# Altium project Phaser.PrjPCB (part 11 of 11)
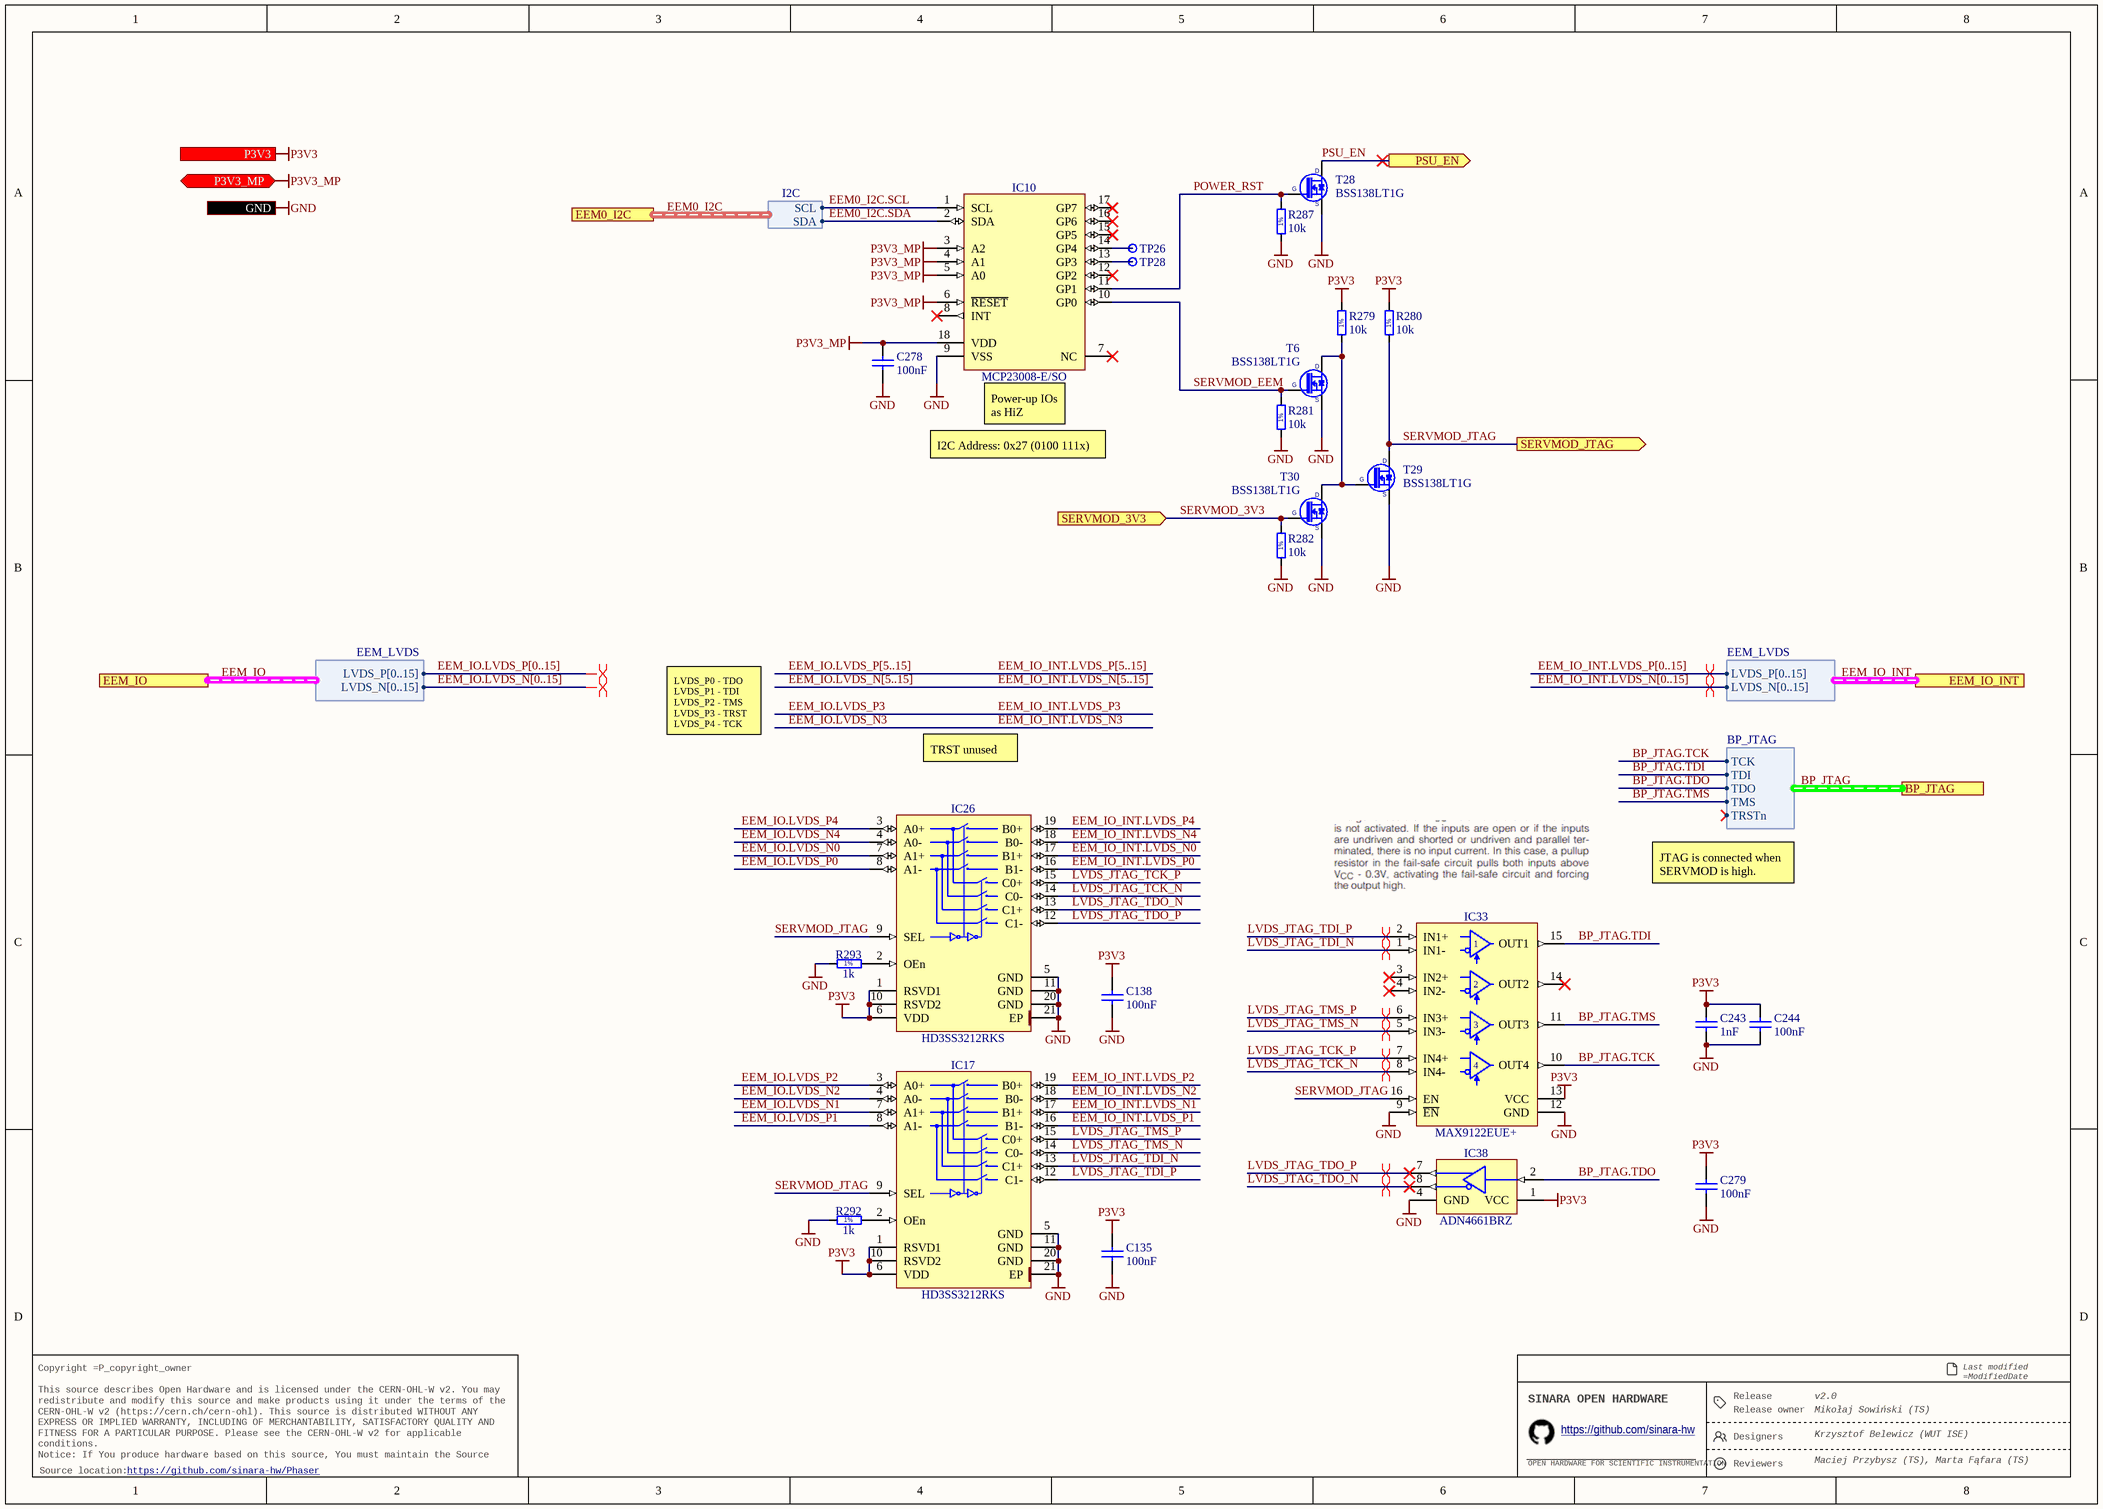
[diagram p129: JTAG_Switch.SchDoc]

## Assembly variants
EEM_Baseband: not fitted B14B B15B B16B B17B B18B B19B C11 C30A C30B C31 C32 C37 C43A C43B C44A C44B C45A C45B C46A C46B C126A C126B C127A C127B C128A C128B C129A C129B C130A C130B C133A C133B C134A C134B C146 C153A C153B C154A C154B C246A C246B C280A C280B C281A C281B C282A C282B C283A C283B C284A C284B C285A C285B C286A C286B C287A C287B C288A C288B C289A C289B C354A C354B C355A C355B C356A C356B C357A C357B C358A C358B C369A C369B C369C C369D C370A C370B C370C C370D C371A C371B C371C C371D C372A C372B C372C C372D C373A C373B C373C C373D C374A C374B C374C C374D C375A C375B C375C C375D C376A C376B C376C C376D C377A C377B C377C C377D C382 C383 C384 C385 C386 C387 C388 C389 HS3A HS3B IC2A IC2B IC34 J9 J14A J14B J16 J17 L19A L19B L20A L20B L22A L22B L24A L24B L25A L25B L27A L27B L29A L29B L31A L31B L33A L33B L34A L34B L35A L35B L38A L38B L52A L52B R2 R3 R8A R8B R11 R12 R13 R14 R15 R16 R17 R21 R24 R27 R31 R32 R37 R38A R38B R39 R40 R41A R41B R42 R45 R46 R47 R49A R49B R50 R52 R54 R56 R59 R61 R62 R63 R66 R67 R68 R69 R70 R71A R71B R73 R76 R77 R81 R85 R86 R98A R98B R150 R156 R157 R193A R193B R194A R194B R195A R195B R196A R196B R224A R224B R225A R225B R226A R226B R227 R228 R229 R230 R231 R232 R244 R245 R257 R282 T30 T_IC3 T_IC5 T_J4 T_J5 T_R2 T_R4 T_R11 T_R12 T_R35 T_R36 T_R37 T_R38 T_R39 T_R40 T_R41 T_R42 T_R43 T_R44 T_R45 T_R46 T_R47 T_R48 T_R49 T_R50 T_R51 T_R52 T_R53 T_R54 T_R55 T_R56 T_R57 T_R58 T_R59 T_R60 T_R61 T_R62 T_R63 T_R64 T_R65 T_R66 TR6A TR6B TR7 TR9 TR10 TR11; alternate parts T_R26 -> R0805_0R_JUMPER
EEM_Upconverter: not fitted C11 C14A C14B C15A C15B C16A C16B C31 C32 C37 C146 C270A C270B C272A C272B C273A C273B C274A C274B C275A C275B C276A C276B C369C C369D C370C C370D C371C C371D C372C C372D C373C C373D C374C C374D C375C C375D C376C C376D C377C C377D IC34 J9 L29A L29B L31A L31B L33A L33B L38A L38B R2 R3 R8A R8B R11 R12 R13 R14 R15 R16 R17 R21 R24 R27 R31 R32 R37 R38A R38B R39 R40 R41A R41B R42 R45 R46 R47 R50 R52 R54 R56 R59 R61 R62 R63 R66 R67 R68 R69 R70 R73 R76 R77 R81 R85 R86 R98A R98B R150 R156 R157 R227 R228 R229 R230 R231 R232 R236 R245 R246 R247 R249 R250 R251 R252 R253 R254 R282 T30 T_IC3 T_IC5 T_J4 T_J5 T_R2 T_R4 T_R11 T_R12 T_R35 T_R36 T_R37 T_R38 T_R39 T_R40 T_R41 T_R42 T_R43 T_R44 T_R45 T_R46 T_R47 T_R48 T_R49 T_R50 T_R51 T_R52 T_R53 T_R54 T_R55 T_R56 T_R57 T_R58 T_R59 T_R60 T_R61 T_R62 T_R63 T_R64 T_R65 T_R66 TR3 TR4 TR5 TR8; alternate parts T_R26 -> R0805_0R_JUMPER
DIOT_Baseband: not fitted B14B B15B B16B B17B B18B B19B C11 C30A C30B C31 C32 C37 C43A C43B C44A C44B C45A C45B C46A C46B C126A C126B C127A C127B C128A C128B C129A C129B C130A C130B C133A C133B C134A C134B C146 C153A C153B C154A C154B C246A C246B C280A C280B C281A C281B C282A C282B C283A C283B C284A C284B C285A C285B C286A C286B C287A C287B C288A C288B C289A C289B C354A C354B C355A C355B C356A C356B C357A C357B C358A C358B C369A C369B C369C C369D C370A C370B C370C C370D C371A C371B C371C C371D C372A C372B C372C C372D C373A C373B C373C C373D C374A C374B C374C C374D C375A C375B C375C C375D C376A C376B C376C C376D C377A C377B C377C C377D C382 C383 C384 C385 C386 C387 C388 C389 HS3A HS3B IC2A IC2B IC34 J9 J14A J14B J16 J17 L19A L19B L20A L20B L22A L22B L24A L24B L25A L25B L27A L27B L29A L29B L31A L31B L33A L33B L34A L34B L35A L35B L38A L38B L52A L52B R2 R3 R8A R8B R11 R12 R13 R14 R15 R16 R17 R21 R24 R27 R31 R32 R37 R38A R38B R39 R40 R41A R41B R42 R45 R46 R47 R49A R49B R50 R52 R54 R56 R59 R61 R62 R63 R66 R67 R68 R69 R70 R71A R71B R73 R76 R77 R81 R85 R86 R98A R98B R150 R156 R157 R193A R193B R194A R194B R195A R195B R196A R196B R224A R224B R225A R225B R226A R226B R227 R228 R229 R230 R231 R232 R244 R245 R257 R282 T30 T_IC3 T_IC5 T_J1 T_J2 T_R9 T_R10 TR6A TR6B TR7 TR9 TR10 TR11
DIOT_Upconverter: not fitted C11 C14A C14B C15A C15B C16A C16B C31 C32 C37 C146 C270A C270B C272A C272B C273A C273B C274A C274B C275A C275B C276A C276B C369C C369D C370C C370D C371C C371D C372C C372D C373C C373D C374C C374D C375C C375D C376C C376D C377C C377D IC34 J9 L29A L29B L31A L31B L33A L33B L38A L38B R2 R3 R8A R8B R11 R12 R13 R14 R15 R16 R17 R21 R24 R27 R31 R32 R37 R38A R38B R39 R40 R41A R41B R42 R45 R46 R47 R50 R52 R54 R56 R59 R61 R62 R63 R66 R67 R68 R69 R70 R73 R76 R77 R81 R85 R86 R98A R98B R150 R156 R157 R227 R228 R229 R230 R231 R232 R236 R245 R246 R247 R249 R250 R251 R252 R253 R254 R282 T30 T_IC3 T_IC5 T_J1 T_J2 T_R9 T_R10 TR3 TR4 TR5 TR8